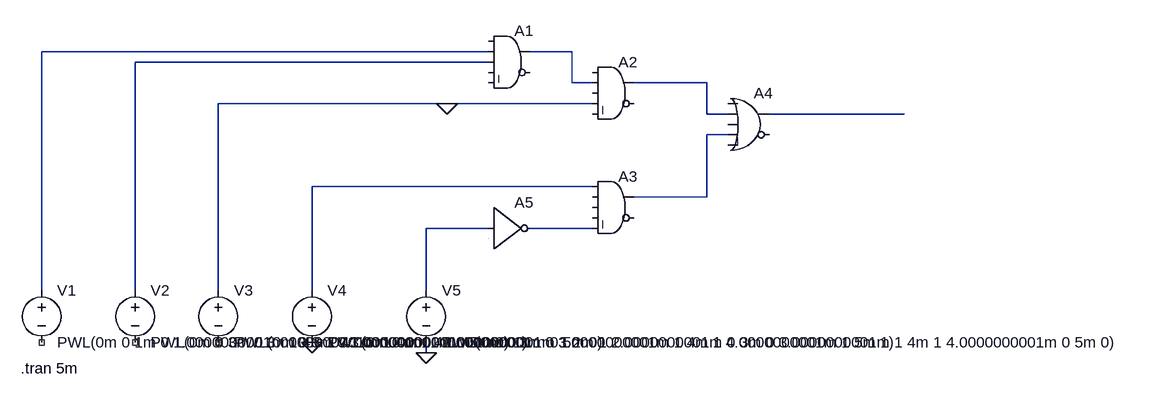
[diagram p0: schematic q47.asc]
q47.asc, the LTspice schematic file:
Version 4.1
SHEET 1 1260 680
WIRE 176 80 -512 80
WIRE 304 80 240 80
WIRE 176 96 -368 96
WIRE 304 128 304 80
WIRE 336 128 304 128
WIRE 512 128 400 128
WIRE 112 160 -240 160
WIRE 336 160 112 160
WIRE 512 176 512 128
WIRE 544 176 512 176
WIRE 816 176 608 176
WIRE 544 208 512 208
WIRE 336 288 -96 288
WIRE 512 304 512 208
WIRE 512 304 400 304
WIRE 176 352 80 352
WIRE 336 352 240 352
WIRE -512 448 -512 80
WIRE -368 448 -368 96
WIRE -240 448 -240 160
WIRE -96 448 -96 288
WIRE 80 448 80 352
WIRE 80 544 80 528
FLAG 80 544 0
FLAG -96 528 0
FLAG 112 160 0
SYMBOL Digital\\and 208 32 R0
SYMATTR InstName A1
SYMBOL Digital\\and 368 80 R0
SYMATTR InstName A2
SYMBOL Digital\\and 368 256 R0
SYMATTR InstName A3
SYMBOL Digital\\or 576 128 R0
SYMATTR InstName A4
SYMBOL Digital\\inv 176 288 R0
SYMATTR InstName A5
SYMBOL voltage -512 432 R0
WINDOW 123 0 0 Left 0
WINDOW 39 0 0 Left 0
SYMATTR InstName V1
SYMATTR Value PWL(0m 0 1m 0 1.0000000001m 1 4m 1 4.0000000001m 0 5m 0)
SYMBOL voltage -368 432 R0
WINDOW 123 0 0 Left 0
WINDOW 39 0 0 Left 0
SYMATTR InstName V2
SYMATTR Value PWL(0m 0 3m 0 3.0000000001m 1 4m 1 4.0000000001m 0 5m 0)
SYMBOL voltage -240 432 R0
WINDOW 123 0 0 Left 0
WINDOW 39 0 0 Left 0
SYMATTR InstName V3
SYMATTR Value PWL(0m 0 3m 0 3.00000000001m 1 4m 1)
SYMBOL voltage -96 432 R0
WINDOW 123 0 0 Left 0
WINDOW 39 0 0 Left 0
SYMATTR InstName V4
SYMATTR Value PWL(0m 0 1m 0 1.0000000001m 1 2m 1 2.0000000001m 0 3m 0 3.0000000001m 1 4m 1 4.0000000001m 0 5m 0)
SYMBOL voltage 80 432 R0
WINDOW 123 0 0 Left 0
WINDOW 39 0 0 Left 0
SYMATTR InstName V5
SYMATTR Value PWL(0m 0 3m 0 3.0000000001m 1 4m 1 4.0000000001m 1 5m 1)
TEXT -544 568 Left 2 !.tran 5m

The netlist it stands for:
* q47.asc
A1 0 N001 N003 0 0 0 N002 0 AND
A2 0 N002 0 0 0 0 N004 0 AND
A3 N007 0 0 0 N009 0 N006 0 AND
A4 0 N004 0 N006 0 0 N005 0 OR
A5 N008 0 0 0 0 N009 0 0 BUF
V1 N001 NC_01 PWL(0m 0 1m 0 1.0000000001m 1 4m 1 4.0000000001m 0 5m 0)
V2 N003 NC_02 PWL(0m 0 3m 0 3.0000000001m 1 4m 1 4.0000000001m 0 5m 0)
V3 0 NC_03 PWL(0m 0 3m 0 3.00000000001m 1 4m 1)
V4 N007 0 PWL(0m 0 1m 0 1.0000000001m 1 2m 1 2.0000000001m 0 3m 0 3.0000000001m 1 4m 1 4.0000000001m 0 5m 0)
V5 N008 0 PWL(0m 0 3m 0 3.0000000001m 1 4m 1 4.0000000001m 1 5m 1)
.tran 5m
.backanno
.end